# Altium project LogNController-v1.1.PrjPcb (part 3 of 3)

## Sheet Controller-Sheet.SchDoc
size A4; SheetNumber: 3; SheetTotal: 8
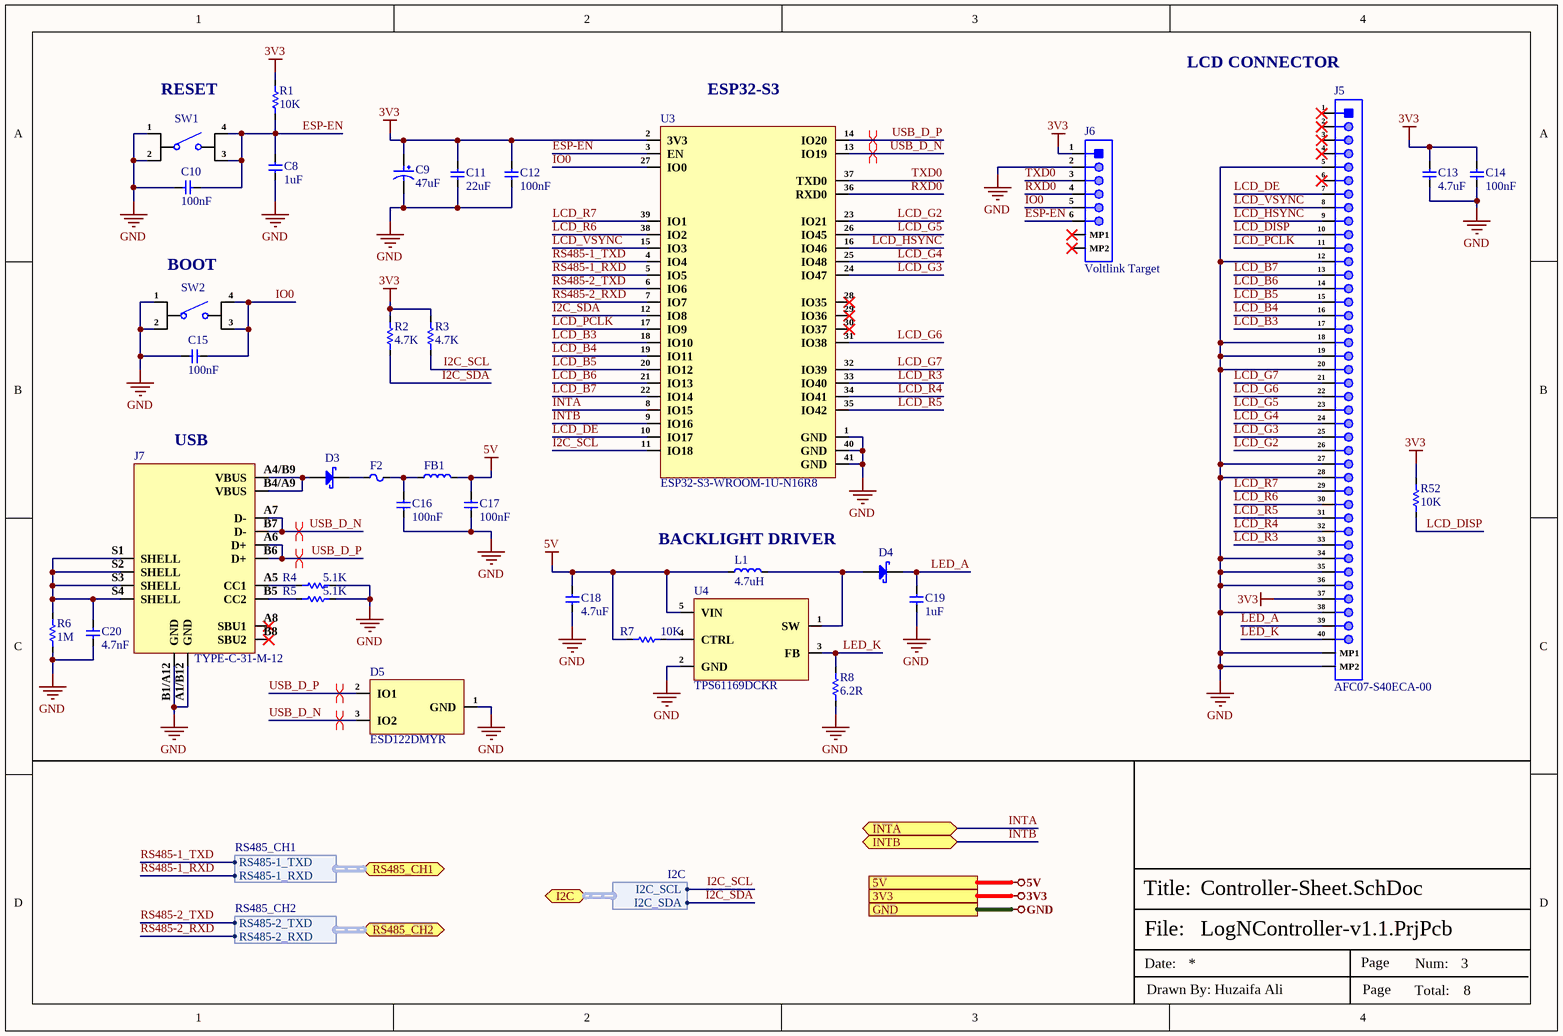
[diagram p7: Controller-Sheet.SchDoc]

### Parts
C8  1uF  [Cap-0603]
C9  47uF  [RVT1H470M0607]
C10  100nF  [Cap-0603]
C11  22uF  [Cap-0603]
C12  100nF  [Cap-0603]
C13  4.7uF  [Cap-0603]
C14  100nF  [Cap-0603]
C15  100nF  [Cap-0603]
C16  100nF  [Cap-0603]
C17  100nF  [Cap-0603]
C18  4.7uF  [Cap-0603]
C19  1uF  [Cap-0603]
C20  4.7nF  [Cap-1206]
D3  SS24A  [SMA]  (value not drawn)
D4  NSR0240HT1G  [SOD-323]  (value not drawn)
D5  ESD122DMYR  [X2-SON-3(0.6x1.3).]
F2  BSMD0603L-100  [fuse-0603]  (value not drawn)
FB1  BLM18SG121TN1D  [IND-0603 (1608 Metric)]  (value not drawn)
J5  AFC07-S40ECA-00  [AFC07-S40ECA-00]
J6  Voltlink Target  [Voltlink Target]
J7  TYPE-C-31-M-12  [TYPE-C-31-M-12_]
L1  4.7uH  [MWSA0402S-4R7MT]
R1  10K  [Res-0603]
R2  4.7K  [Res-0402]
R3  4.7K  [Res-0402]
R4  5.1K  [Res-0402]
R5  5.1K  [Res-0402]
R6  1M  [Res-0603]
R7  10K  [Res-0603]
R8  6.2R  [Res-1206]
R52  10K  [Res-0603]
SW1  TS-1109S-C-B  [TS-1109S-C-B]  (value not drawn)
SW2  TS-1109S-C-B  [TS-1109S-C-B]  (value not drawn)
U3  ESP32-S3-WROOM-1U-N16R8  [41-SMD UFL Module]
U4  TPS61169DCKR  [SC70-5]

### Ports
3V3 (see Top-Sheet[2A], ADC-Sheet[3D], Buttons-Sheet[3D], IO-Expander-Sheet[3D], Power-Sheet[3D], Sensor-Comms-Sheet[3D]), 5V (see Top-Sheet[2A], ADC-Sheet[3D], Power-Sheet[3D], Relay-Sheet[3D]), GND (see Top-Sheet[2A], ADC-Sheet[3D], Buttons-Sheet[3D], IO-Expander-Sheet[3D], Power-Sheet[3D], Relay-Sheet[3D], Sensor-Comms-Sheet[3D]), I2C (bidir, harness I2C, see Top-Sheet[2C], ADC-Sheet[2D], IO-Expander-Sheet[3D]), INTA (bidir, see Top-Sheet[3B], IO-Expander-Sheet[3D]), INTB (bidir, see Top-Sheet[3B], IO-Expander-Sheet[3D]), RS485_CH1 (bidir, harness RS485_CH1, see Top-Sheet[2B], Sensor-Comms-Sheet[1D]), RS485_CH2 (bidir, harness RS485_CH2, see Top-Sheet[2B], Sensor-Comms-Sheet[1D])

### Harnesses
I2C: I2C_SCL, I2C_SDA
RS485_CH2: RS485-2_TXD, RS485-2_RXD
RS485_CH1: RS485-1_TXD, RS485-1_RXD

### Nets
3V3: C9.1 C11.2 C12.2 C13.2 C14.2 J5.37 J6.1 R1.2 R2.2 R3.2 R52.2 U3.2(3V3) ; port 3V3
5V: C17.2 C18.2 FB1.2 L1.1 R7.2 U4.5(VIN) ; port 5V
GND: C8.1 C9.2 C10.2 C11.1 C12.1 C13.1 C14.1 C15.2 C16.1 C17.1 C18.1 C19.1 C20.1 D5.1(GND) J5.5 J5.12 J5.18 J5.19 J5.20 J5.27 J5.28 J5.34 J5.35 J5.36 J5.38 J5.MP1 J5.MP2 J6.2 J7.A1/B12(GND) J7.B1/A12(GND) R4.2 R5.2 R6.1 R8.1 SW1.1 SW1.2 SW2.1 SW2.2 U3.1(GND) U3.40(GND) U3.41(GND) U4.2(GND) ; port GND
ESP-EN: C8.2 C10.1 J6.6 R1.1 SW1.3 SW1.4 U3.3(EN)
I2C_SCL: R3.1 U3.11(IO18) ; port I2C.I2C_SCL
I2C_SDA: R2.1 U3.12(IO8) ; port I2C.I2C_SDA
INTA: U3.8(IO15) ; port INTA
INTB: U3.9(IO16) ; port INTB
IO0: C15.1 J6.5 SW2.3 SW2.4 U3.27(IO0)
LCD_B3: J5.17 U3.18(IO10)
LCD_B4: J5.16 U3.19(IO11)
LCD_B5: J5.15 U3.20(IO12)
LCD_B6: J5.14 U3.21(IO13)
LCD_B7: J5.13 U3.22(IO14)
LCD_DE: J5.7 U3.10(IO17)
LCD_DISP: J5.10 R52.1
LCD_G2: J5.26 U3.23(IO21)
LCD_G3: J5.25 U3.24(IO47)
LCD_G4: J5.24 U3.25(IO48)
LCD_G5: J5.23 U3.26(IO45)
LCD_G6: J5.22 U3.31(IO38)
LCD_G7: J5.21 U3.32(IO39)
LCD_HSYNC: J5.9 U3.16(IO46)
LCD_PCLK: J5.11 U3.17(IO9)
LCD_R3: J5.33 U3.33(IO40)
LCD_R4: J5.32 U3.34(IO41)
LCD_R5: J5.31 U3.35(IO42)
LCD_R6: J5.30 U3.38(IO2)
LCD_R7: J5.29 U3.39(IO1)
LCD_VSYNC: J5.8 U3.15(IO3)
LED_A: C19.2 D4.1(K) J5.39
LED_K: J5.40 R8.2 U4.3(FB)
RS485-1_RXD: U3.5(IO5) ; port RS485_CH1.RS485-1_RXD
RS485-1_TXD: U3.4(IO4) ; port RS485_CH1.RS485-1_TXD
RS485-2_RXD: U3.7(IO7) ; port RS485_CH2.RS485-2_RXD
RS485-2_TXD: U3.6(IO6) ; port RS485_CH2.RS485-2_TXD
RXD0: J6.4 U3.36(RXD0)
TXD0: J6.3 U3.37(TXD0)
USB_D_N: D5.3(IO2) J7.A7(D-) J7.B7(D-) U3.13(IO19)
USB_D_P: D5.2(IO1) J7.A6(D+) J7.B6(D+) U3.14(IO20)
NetC16_2: C16.2 F2.2 FB1.1
NetC20_2: C20.2 J7.S1(SHELL) J7.S2(SHELL) J7.S3(SHELL) J7.S4(SHELL) R6.2
NetD3_1: D3.1(K) F2.1
NetD3_2: D3.2(A) J7.A4/B9(VBUS) J7.B4/A9(VBUS)
NetD4_2: D4.2(A) L1.2 U4.1(SW)
NetJ7_A5: J7.A5(CC1) R4.1
NetJ7_B5: J7.B5(CC2) R5.1
NetR7_1: R7.1 U4.4(CTRL)

Not connected (* = marked no-connect by the designer): J5 1* 2* 3* 4* 6*; J6 MP1* MP2*; J7 A8(SBU1)* B8(SBU2)*; U3 28(IO35)* 29(IO36)* 30(IO37)*

### Layout directives
differential pair; net class USB_PROGRAM; differential pair class USB_PROGRAM_LINES; rule Impedance Constraint [Min = 85.00    Max = 90.00    ]; rule Matched Net Lengths [Tolerance = 50mil]: USB_D_N, USB_D_P

### Notes on the sheet
- (near SW1) RESET
- (near U3) ESP32-S3
- LCD CONNECTOR
- (near SW2) BOOT
- (near J7) USB
- (near L1) BACKLIGHT DRIVER
- File:
- Title:
- Date:
- Page
- Num:
- Total:
- Drawn By: Huzaifa Ali

### Library data of the parts
C8 C19 = CL10A105KB8NNNC: CAP CER 1UF 50V X5R 0603; Manufacturer: Samsung; Material: 4241ConductorMaterial; Tolerance: 10%; Item Type: Capacitor; Supplier: Avnet; Supplier Part Number: CL10A105KB8NNNC; Manufacturer Part Number: CL10A105KB8NNNC; RoHS: Yes; Category: Ceramic Capacitors; Stock: 780446; Pricing: 4000=0.01632, 8000=0.01595, 16000=0.01557, 24000=0.0152, 32000=0.01482 (USD); Mounting Technology: Surface Mount; Case/Package: 0603; Case Code (Metric): 1608; Case Code (Imperial): 0603; Min Operating Temperature: -55°C; Max Operating Temperature: 85°C; Packaging: Tape and Reel; Value: 1uF; Voltage Rating: 50V; Dielectric: X5R; Series: CL; Voltage Rating (DC): 50V; Length: 1.6mm; Depth: 0.8mm; Radiation Hardening: No; RoHS Compliant: Yes; ComponentLink1URL: https://datasheet.ciiva.com/26877/getdatasheetpartid-753736-26877879.pdf?src-supplier=Verical; ComponentLink1Description: https://datasheet.ciiva.com/26877/getdatasheetpartid-753736-26877879.pdf?src-supplier=Verical; LCSC Part Number: C15849
C9 = RVT1H470M0607: 47uF 50V 66mA@120Hz ±20% SMD,D6.3xL7.7mm Aluminum Electrolytic Capacitors - SMD ROHS; Manufacturer: ROQANG; Manufacturer Part Number: RVT1H470M0607; Package: SMD,D6.3xL7.7mm; LCSC Part Number: C72523; Item Type: Capacitor; ComponentLink1Description: LCSC; ComponentLink1URL: https://www.lcsc.com/product-detail/Aluminum-Electrolytic-Capacitors-SMD_ROQANG-RVT1H470M0607_C72523.html
C10 C12 C14-C17 = CC0603KRX5R9BB104: CAP CER 0.1UF 50V X5R 0603; Manufacturer: Yageo; Tolerance: 10%; Item Type: Capacitor; Supplier 1: Digi-Key; Manufacturer Part Number: CC0603KRX5R9BB104; RoHS: Yes; Category: Ceramic Capacitors; Stock 1: 152253; Pricing 1: 1=0.10000, 10=0.05200, 50=0.02820, 100=0.02310, 500=0.01648, 1000=0.01294 (USD); Mount: Surface Mount; Case/Package: 0603; Case Code (Imperial): 0603; Case Code (Metric): 1608; Weight: 7.1E-05oz; Min Operating Temperature: -55°C; Max Operating Temperature: 85°C; Capacitance: 100nF; Packaging: Tape and Reel; Voltage Rating: 50V; Dielectric: X5R; Termination: SMD/SMT; Voltage Rating (DC): 50V; Package Quantity: 4000; Length: 0.063inch; Width: 0.031inch; Thickness: 0.035inch; Lead Free: Lead Free; Halogen Free: Halogen Free; ComponentLink1URL: http://www.mouser.com/ds/2/447/Yageo_UPY-GP_NP0_16V-to-50V_9-358835.pdf?src-supplier=Mouser; ComponentLink1Description: http://www.mouser.com/ds/2/447/Yageo_UPY-GP_NP0_16V-to-50V_9-358835.pdf?src-supplier=Mouser; ComponentLink2URL: https://www.yageo.com/upload/media/product/productsearch/datasheet/mlcc/UPY-GPHC_X5R_4V-to-50V_26.pdf?src-supplier=Digi-Key; ComponentLink2Description: https://www.yageo.com/upload/media/product/productsearch/datasheet/mlcc/UPY-GPHC_X5R_4V-to-50V_26.pdf?src-supplier=Digi-Key; ComponentLink3URL: http://www.yageo.com/exep/pages/download/literatures/ProductSelectionGuide%202014_Final_2.pdf?src-supplier=Digi-Key; ComponentLink3Description: http://www.yageo.com/exep/pages/download/literatures/ProductSelectionGuide%202014_Final_2.pdf?src-supplier=Digi-Key; Supplier Part Number 1: 311-4046-1-ND; LCSC Part Number: C110022
C11 = CC0603MRX5R6BB226: CAP CER 22UF 10V X5R 0603; Manufacturer: Yageo; Tolerance: 20%; Item Type: Capacitor; Supplier 1: Digi-Key; Manufacturer Part Number: CC0603MRX5R6BB226; RoHS: Yes; Category: Ceramic Capacitors; Stock 1: 19628; Pricing 1: 1=0.68000, 10=0.48000, 50=0.36300, 100=0.31610, 500=0.23416, 1000=0.19903 (USD); Mount: Surface Mount; Case/Package: 0603; Case Code (Metric): 1608; Case Code (Imperial): 0603; Weight: 7.1E-05oz; Min Operating Temperature: -55°C; Max Operating Temperature: 85°C; Packaging: Tape and Reel; Capacitance: 22uF; Voltage Rating: 10V; Dielectric: X5R; Termination: SMD/SMT; Voltage Rating (DC): 10V; Package Quantity: 4000; Length: 0.063inch; Width: 0.8mm; Height: 0.8mm; Thickness: 0.035inch; Lead Free: Lead Free; Halogen Free: Halogen Free; RoHS Compliant: Yes; ComponentLink1URL: http://www.mouser.com/ds/2/447/Yageo_UPY-GP_NP0_16V-to-50V_9-358835.pdf?src-supplier=Mouser; ComponentLink1Description: http://www.mouser.com/ds/2/447/Yageo_UPY-GP_NP0_16V-to-50V_9-358835.pdf?src-supplier=Mouser; ComponentLink2URL: http://www.yageo.com/documents/recent/UPY-GPHC_X5R_4V-to-50V_25.pdf?src-supplier=Digi-Key; ComponentLink2Description: http://www.yageo.com/documents/recent/UPY-GPHC_X5R_4V-to-50V_25.pdf?src-supplier=Digi-Key; Supplier Part Number 1: 311-1819-1-ND; LCSC Part Number: C109447
C13 C18 = CC0603KRX5R7BB475: CAP CER 4.7UF 16V X5R 0603; Manufacturer: Yageo; Tolerance: 10%; Item Type: Capacitor; Supplier 1: Digi-Key; Manufacturer Part Number: CC0603KRX5R7BB475; RoHS: Yes; Category: Ceramic Capacitors; Stock 1: 547703; Pricing 1: 1=0.20000, 10=0.13800, 50=0.08280, 100=0.06990, 500=0.04784, 1000=0.04233 (USD); Mount: Surface Mount; Case/Package: 0603; Case Code (Imperial): 0603; Case Code (Metric): 1608; Weight: 7.1E-05oz; Min Operating Temperature: -55°C; Max Operating Temperature: 85°C; Capacitance: 4.7uF; Voltage Rating: 16V; Voltage Rating (DC): 16V; Packaging: Tape and Reel; Dielectric: X5R; Termination: SMD/SMT; Resistor Type: Ceramic; Series: CC; Length: 1.6mm; Width: 0.8mm; Height: 0.8mm; Thickness: 0.037inch; Depth: 0.8mm; Lead Free: Lead Free; Halogen Free: Halogen Free; RoHS Compliant: Yes; ComponentLink1URL: http://www.mouser.com/ds/2/447/UPY-GPHC_X5R_4V-to-50V_25-1131599.pdf?src-supplier=Mouser; ComponentLink1Description: http://www.mouser.com/ds/2/447/UPY-GPHC_X5R_4V-to-50V_25-1131599.pdf?src-supplier=Mouser; ComponentLink2URL: http://www.yageo.com/documents/recent/UPY-GPHC_X5R_4V-to-50V_25.pdf?src-supplier=Digi-Key; ComponentLink2Description: http://www.yageo.com/documents/recent/UPY-GPHC_X5R_4V-to-50V_25.pdf?src-supplier=Digi-Key; Supplier Part Number 1: 311-1785-1-ND; LCSC Part Number: C277476
C20 = CC1206KKX7RCBB472: CAP CER 4700PF 1KV X7R 1206; Manufacturer: Yageo; Dielectric Material: Ceramic; Tolerance: 10%; Item Type: Capacitor; Supplier 1: Future Electronics; Manufacturer Part Number: CC1206KKX7RCBB472; RoHS: Yes; Category: Ceramic Capacitors; Stock 1: 180000; Pricing 1: 3000=0.02860, 9000=0.02750, 15000=0.02700, 45000=0.02600, 75000=0.02510 (USD); Mount: Surface Mount; Case/Package: 1206; Number of Pins: 2; Case Code (Imperial): 1206; Case Code (Metric): 3216; Weight: 0.000571oz; Min Operating Temperature: -55°C; Max Operating Temperature: 125°C; Voltage Rating: 1kV; Capacitance: 4.7nF; Packaging: Tape and Reel; Voltage Rating (DC): 1kV; Dielectric: X7R; Termination: SMD/SMT; Resistor Type: Ceramic; Series: CC; Length: 3.2mm; Width: 0.063inch; Thickness: 0.057inch; Depth: 1.6mm; Radiation Hardening: No; Lead Free: Lead Free; RoHS Compliant: Yes; ComponentLink1URL: https://datasheet.ciiva.com/13208/upy-gp-np0-16v-to-50v-8-13208693.pdf?src-supplier=Mouser; ComponentLink1Description: https://datasheet.ciiva.com/13208/upy-gp-np0-16v-to-50v-8-13208693.pdf?src-supplier=Mouser; ComponentLink2URL: https://datasheet.ciiva.com/11466/hv-11466701.pdf?src-supplier=Avnet; ComponentLink2Description: https://datasheet.ciiva.com/11466/hv-11466701.pdf?src-supplier=Avnet; Supplier Part Number 1: 7130131; LCSC Part Number: C107198
D3 = SS24A: 40V 500mV@2A 2A SMA(DO-214AC) Schottky Barrier Diodes (SBD) ROHS; Manufacturer: Guangdong Hottech; Manufacturer Part Number: SS24A; Package: SMA(DO-214AC); LCSC Part Number: C2886579; ComponentLink1Description: LCSC; ComponentLink1URL: https://www.lcsc.com/product-detail/Schottky-Barrier-Diodes-SBD_Guangdong-Hottech-SS24A_C2886579.html
D4 = NSR0240HT1G: DIODE SCHOTTKY 40V 250MA SOD323; Manufacturer: ON Semiconductor; Value: 4pF; Supplier: Avnet; LCSC Part Number: C152519; Manufacturer Part Number: NSR0240HT1G; RoHS: Yes; Item Type: Diode; Stock: 6655; Pricing: 1=0.272, 25=0.186, 50=0.139, 100=0.091, 250=0.084 (USD); Reverse Voltage: 40V; ComponentLink1URL: https://datasheet.ciiva.com/915/nsr0240h-d-915416.pdf?src-supplier=Digikey; ComponentLink1Description: https://datasheet.ciiva.com/915/nsr0240h-d-915416.pdf?src-supplier=Digikey; ComponentLink2URL: https://datasheet.ciiva.com/915/nsr0240h-d-915417.pdf?src-supplier=Digikey; ComponentLink2Description: https://datasheet.ciiva.com/915/nsr0240h-d-915417.pdf?src-supplier=Digikey; ComponentLink3URL: https://datasheet.ciiva.com/915/nsr0240h-d-915418.pdf?src-supplier=Digikey; ComponentLink3Description: https://datasheet.ciiva.com/915/nsr0240h-d-915418.pdf?src-supplier=Digikey; ComponentLink4URL: https://datasheet.ciiva.com/16396/nsr0240h-d-16396521.pdf?src-supplier=Future+Electronics; ComponentLink4Description: https://datasheet.ciiva.com/16396/nsr0240h-d-16396521.pdf?src-supplier=Future+Electronics
D5 = ESD122DMYR: TVS DIODE 3.6VWM 8.4VC 3X2SON; Manufacturer: Texas Instruments; Interface: USB,GPIO,HDMI,PCIe,SATA; Number of Channels: 2; Reverse Standoff Voltage: 3.6V; Min Breakdown Voltage: 5.1V; Peak Pulse Current: 2.5A; Peak Pulse Power: 20W; Power Line Protection: No; Diode Type: ZENER; Item Type: TVS/ESD; Supplier: Mouser; Supplier Part Number: 595-ESD122DMYR; Manufacturer Part Number: ESD122DMYR; RoHS: Yes; Category: Integrated Circuits (ICs); Stock: 137267; Pricing: 1=0.38, 10=0.33, 50=0.33, 100=0.252, 1000=0.172, 10000=0.152 (USD); Mounting Technology: Surface Mount; Pins: 3; Min Operating Temperature: -40°C; Max Operating Temperature: 125°C; Packaging: Cut Tape; Number of Bidirectional Channels: 2; Series: -; RoHS Compliant: Yes; ComponentLink1URL: http://www.ti.com/general/docs/lit/getliterature.tsp?genericPartNumber=ESD122&fileType=pdf&src-supplier=Farnell; ComponentLink1Description: http://www.ti.com/general/docs/lit/getliterature.tsp?genericPartNumber=ESD122&fileType=pdf&src-supplier=Farnell; ComponentLink2URL: http://www.ti.com/lit/ds/symlink/esd122.pdf?src-supplier=Digikey; ComponentLink2Description: http://www.ti.com/lit/ds/symlink/esd122.pdf?src-supplier=Digikey; ComponentLink3URL: http://www.ti.com/general/docs/suppproductinfo.tsp?distId=10&amp;gotoUrl=http%3A%2F%2Fwww.ti.com%2Flit%2Fgpn%2Fesd122&src-supplier=Digikey; ComponentLink3Description: http://www.ti.com/general/docs/suppproductinfo.tsp?distId=10&amp;gotoUrl=http%3A%2F%2Fwww.ti.com%2Flit%2Fgpn%2Fesd122&src-supplier=Digikey; LCSC Part Number: C1975871
F2 = BSMD0603L-100: 6V 1A 50A 1W -40℃~+85℃ 2A 9mΩ 0.5s 80mΩ 0603 Resettable Fuses ROHS; Manufacturer: BHFUSE; Item Type: Fuse; ComponentLink1Description: LCSC; ComponentLink1URL: https://lcsc.com/product-detail/Resettable-Fuses_BHFUSE-BSMD0603L-100_C2757929.html; Manufacturer Part Number: BSMD0603L-100; Package: 0603; LCSC Part Number: C2757929
FB1 = BLM18SG121TN1D: FERRITE BEAD 120 OHM 0603 1LN; Manufacturer: Murata; Material: Steel,Ferrite; Tolerance: 25%; Impedance: 120R; DC Resistance (DCR): 25mR; Max DC Current: 3A; Number of Lines: 1; Test Frequency: 100MHz; Shielding: Unshielded; Supplier 1: Arrow Electronics; Manufacturer Part Number: BLM18SG121TN1D; RoHS: Yes; Category: Ferrite Beads and Chips; Stock 1: 82612; Pricing 1: 1=0.12640, 10=0.08350, 25=0.07210, 100=0.05150, 250=0.04730, 500=0.04110, 1000=0.03420, 3000=0.03360, 6000=0.03320, 15000=0.03270, 30000=0.03200, 75000=0.03150 (USD); Case/Package: 0603; Number of Pins: 2; Core Material: Ferrite; Case Code (Metric): 1608; Case Code (Imperial): 0603; Min Operating Temperature: -55°C; Max Operating Temperature: 125°C; Package Quantity: 1; Max Current Rating: 3A; Packaging: Tape and Reel; Current Rating: 3A; Termination: SMD/SMT; Frequency: 100MHz; Number of Circuits: 1; Series: BLM18S; DC Resistance-Max: 25mR; Length: 1.6mm; Width: 0.8mm; Height: 0.8mm; Depth: 0.8mm; Reach SVHC Compliant: Yes; Lead Free: Lead Free; RoHS Compliant: Yes; ComponentLink1URL: https://datasheet.ciiva.com/1012/l0110s0100blm18s-1012624.pdf?src-supplier=Digi-Key; ComponentLink1Description: https://datasheet.ciiva.com/1012/l0110s0100blm18s-1012624.pdf?src-supplier=Digi-Key; ComponentLink2URL: https://datasheet.ciiva.com/11799/0900766b811b5866-11799181.pdf?src-supplier=RSComponents; ComponentLink2Description: https://datasheet.ciiva.com/11799/0900766b811b5866-11799181.pdf?src-supplier=RSComponents; ComponentLink3URL: https://datasheet.ciiva.com/18093/getdatasheetpartid-295885-18093249.pdf?src-supplier=Verical; ComponentLink3Description: https://datasheet.ciiva.com/18093/getdatasheetpartid-295885-18093249.pdf?src-supplier=Verical; ComponentLink4URL: https://datasheet.ciiva.com/41449/001171723-da-01-en-chip-drossel0603-120r-3000ma-1-6x0-8mm-41449353.pdf?src-supplier=Conrad; ComponentLink4Description: https://datasheet.ciiva.com/41449/001171723-da-01-en-chip-drossel0603-120r-3000ma-1-6x0-8mm-41449353.pdf?src-supplier=Conrad; ComponentLink5URL: https://datasheet.ciiva.com/41449/001172312-da-01-en-drossel-0603-120r-1-6x0-8mm-10000st-41449675.pdf?src-supplier=Conrad; ComponentLink5Description: https://datasheet.ciiva.com/41449/001172312-da-01-en-drossel-0603-120r-1-6x0-8mm-10000st-41449675.pdf?src-supplier=Conrad; ComponentLink6URL: https://datasheet.ciiva.com/8021/5151-8021511.pdf?src-supplier=Element14; ComponentLink6Description: https://datasheet.ciiva.com/8021/5151-8021511.pdf?src-supplier=Element14; ComponentLink7URL: https://datasheet.ciiva.com/8021/5151-8021512.pdf?src-supplier=Element14; ComponentLink7Description: https://datasheet.ciiva.com/8021/5151-8021512.pdf?src-supplier=Element14; ComponentLink8URL: https://datasheet.ciiva.com/14122/blm-series-eng-tds-14122906.pdf?src-supplier=Distrelec; ComponentLink8Description: https://datasheet.ciiva.com/14122/blm-series-eng-tds-14122906.pdf?src-supplier=Distrelec; ComponentLink9URL: https://datasheet.ciiva.com/1012/l0110s0100blm18s-1012623.pdf?src-supplier=Digi-Key; ComponentLink9Description: https://datasheet.ciiva.com/1012/l0110s0100blm18s-1012623.pdf?src-supplier=Digi-Key; ComponentLink10URL: https://datasheet.ciiva.com/1012/l0110s0100blm18s-1012625.pdf?src-supplier=Digi-Key; ComponentLink10Description: https://datasheet.ciiva.com/1012/l0110s0100blm18s-1012625.pdf?src-supplier=Digi-Key; ComponentLink11URL: https://datasheet.ciiva.com/16395/l0110s0100blm18s-16395498.pdf?src-supplier=Future+Electronics; ComponentLink11Description: https://datasheet.ciiva.com/16395/l0110s0100blm18s-16395498.pdf?src-supplier=Future+Electronics; Supplier Part Number 1: BLM18SG121TN1D; LCSC Part Number: C113030; Item Type: Ferrite Bead
J5 = AFC07-S40ECA-00: SMD,P=0.5mm,Surface Mount，Right Angle; Manufacturer: Jushuo; Item Type: FFC/FPC Connector; Supplier: LCSC; LCSC Part Number: C262648; Manufacturer Part Number: AFC07-S40ECA-00; RoHS: No
J6 = C145963: 1x6P SH 1 1mm 6 SMD,P=1mm Wire To Board / Wire To Wire Connector ROHS; Manufacturer: BOOMELE; Manufacturer Part Number: C145963; Package: SMD,P=1mm; LCSC Part Number: C145963; Item Type: Connector; ComponentLink1Description: LCSC; ComponentLink1URL: https://www.lcsc.com/product-detail/Wire-To-Board-Wire-To-Wire-Connector_BOOMELE-Boom-Precision-Elec-C145963_C145963.html
J7 = TYPE-C-31-M-12: 5A 1 16P Female Type-C SMD USB Connectors ROHS; Manufacturer: Korean Hroparts Elec; ComponentLink1Description: LCSC; ComponentLink1URL: https://www.lcsc.com/product-detail/USB-Connectors_Korean-Hroparts-Elec-TYPE-C-31-M-12_C165948.html; Manufacturer Part Number: TYPE-C-31-M-12; Footprint: Custom; LCSC Part Number: C165948; Item Type: USB Connector
L1 = MWSA0402S-4R7MT: Fixed Ind 4.7UH 2.8A 105MOHM SMD; Manufacturer: Sunlord; Item Type: Inductor; Supplier 1: Digi-Key; Manufacturer Part Number: MWSA0402S-4R7MT; RoHS: No; Category: Fixed Inductors; Stock 1: 2808; Pricing 1: 1=0.88000, 10=0.82100, 25=0.75760, 50=0.63120, 100=0.59340, 250=0.53024, 500=0.45450, 1000=0.40400 (USD); Supplier Part Number 1: 3442-MWSA0402S-4R7MTCT-ND; LCSC Part Number: C408337
R1 R7 R52 = RC0603FR-0710KL: RES SMD 10K Ohm 1% 1/10W 0603; Manufacturer: Yageo; Resistance: 10kR; Temperature Coefficient: 100ppm/°C; Voltage Rating (DC): 50V; Power Rating: 100mW; Voltage Rating: 75V; Item Type: Resistor; Supplier 1: Digi-Key; Manufacturer Part Number: RC0603FR-0710KL; RoHS: Yes; Category: Chip SMD Resistors; Stock 1: 25249139; Pricing 1: 1=0.10000, 10=0.02400, 100=0.00970, 1000=0.00436, 2500=0.00378 (USD); Case/Package: 0603; Number of Pins: 2; Case Code (Imperial): 0603; Case Code (Metric): 1608; Weight: 7.1E-05oz; Size Code: 0603; Min Operating Temperature: -55°C; Max Operating Temperature: 155°C; Tolerance: 1%; Resistor Type: Thick Film; Packaging: Tape and Reel; Termination: SMD/SMT; Features: Moisture Resistant; Series: RC; Max Power Dissipation: 100mW; Number of Terminations: 2; Resistance Tolerance: 1%; Construction: Rectangular; Length: 1.6mm; Width: 0.8mm; Height: 0.45mm; Depth: 0.8mm; Lead Pitch: 0.3mm; REACH SVHC: Unknown; Lead Free: Lead Free; Military Standard: Not; RoHS Compliant: Yes; ComponentLink1URL: https://datasheet.ciiva.com/7660/38590-7660789.pdf?src-supplier=Element14; ComponentLink1Description: https://datasheet.ciiva.com/7660/38590-7660789.pdf?src-supplier=Element14; ComponentLink2URL: https://datasheet.ciiva.com/7983/443971-7983596.pdf?src-supplier=Element14; ComponentLink2Description: https://datasheet.ciiva.com/7983/443971-7983596.pdf?src-supplier=Element14; ComponentLink3URL: https://datasheet.ciiva.com/22747/443971-22747519.pdf?src-supplier=Element14; ComponentLink3Description: https://datasheet.ciiva.com/22747/443971-22747519.pdf?src-supplier=Element14; ComponentLink4URL: https://datasheet.ciiva.com/46440/1868787-46440891.pdf?src-supplier=Element14; ComponentLink4Description: https://datasheet.ciiva.com/46440/1868787-46440891.pdf?src-supplier=Element14; ComponentLink5URL: https://datasheet.ciiva.com/7746/1738695-7746239.pdf?src-supplier=Element14; ComponentLink5Description: https://datasheet.ciiva.com/7746/1738695-7746239.pdf?src-supplier=Element14; ComponentLink6URL: https://datasheet.ciiva.com/15189/getdatasheetpartid-409289-15189591.pdf?src-supplier=Verical; ComponentLink6Description: https://datasheet.ciiva.com/15189/getdatasheetpartid-409289-15189591.pdf?src-supplier=Verical; Supplier Part Number 1: 311-10.0KHRCT-ND; LCSC Part Number: C98220
R2 R3 = RC0402FR-074K7L: RES 4.7K OHM 1% 1/16W 0402; Manufacturer: Yageo; Voltage Rating (DC): 50V; Power Rating: 62.5mW; Resistance: 4.7kR; Temperature Coefficient: 100ppm/°C; Max Power Dissipation: 63mW; Item Type: Resistor; Supplier 1: Avnet; Manufacturer Part Number: RC0402FR-074K7L; RoHS: Yes; Category: Chip SMD Resistors; Stock 1: 2420000; Pricing 1: 10000=0.00085 (USD); Case/Package: 0402; Number of Pins: 2; Case Code (Imperial): 0402; Case Code (Metric): 1005; Size Code: 0402; Min Operating Temperature: -55°C; Max Operating Temperature: 155°C; Tolerance: 1%; Voltage Rating: 50V; Packaging: Tape and Reel; Resistor Type: Thick Film; Termination: SMD/SMT; Features: Moisture Resistant; Series: RC; Number of Terminations: 2; Resistance Tolerance: 1%; Construction: Rectangular; Length: 1mm; Width: 0.5mm; Height: 0.32mm; Depth: 0.5mm; Height - Seated (Max): 0.016inch; RoHS Compliant: Yes; Reach SVHC Compliant: Yes; Military Standard: Not; Lead Free: Lead Free; ComponentLink1URL: https://datasheet.ciiva.com/22661/1686128-22661342.pdf?src-supplier=Element14; ComponentLink1Description: https://datasheet.ciiva.com/22661/1686128-22661342.pdf?src-supplier=Element14; ComponentLink2URL: https://datasheet.ciiva.com/7850/1018594-7850022.pdf?src-supplier=Element14; ComponentLink2Description: https://datasheet.ciiva.com/7850/1018594-7850022.pdf?src-supplier=Element14; ComponentLink3URL: https://datasheet.ciiva.com/7850/1018594-7850023.pdf?src-supplier=Element14; ComponentLink3Description: https://datasheet.ciiva.com/7850/1018594-7850023.pdf?src-supplier=Element14; ComponentLink4URL: https://datasheet.ciiva.com/15215/getdatasheetpartid-328119-15215035.pdf?src-supplier=Verical; ComponentLink4Description: https://datasheet.ciiva.com/15215/getdatasheetpartid-328119-15215035.pdf?src-supplier=Verical; Supplier Part Number 1: RC0402FR-074K7L; LCSC Part Number: C105871
R4 R5 = RC0402FR-075K1L: RES 5.1K OHM 1% 1/16W 0402; Manufacturer: Yageo; Power Rating: 63mW; Resistance: 5.1kR; Temperature Coefficient: 100ppm/°C; Voltage Rating: 50V; Item Type: Resistor; Supplier 1: Avnet; Manufacturer Part Number: RC0402FR-075K1L; RoHS: Yes; Category: Chip SMD Resistors; Stock 1: 65000; Pricing 1: 10000=0.00085 (USD); Case/Package: 0402; Case Code (Metric): 1005; Case Code (Imperial): 0402; Min Operating Temperature: -55°C; Max Operating Temperature: 155°C; Tolerance: 1%; Technology: THICK FILM; Packaging: Tape and Reel; Package Quantity: 1; Resistor Type: Thick Film; Number of Terminations: 2; Termination: SMD/SMT; Max Power Dissipation: 63mW; Voltage Rating (DC): 50V; Working Voltage: 50V; Features: Moisture Resistant; Series: RC; Resistance Tolerance: 1%; Construction: Rectangular; Length: 1mm; Width: 0.02inch; Height: 0.016inch; Depth: 0.5mm; RoHS Compliant: Yes; Military Standard: Not; Lead Free: Lead Free; ComponentLink1URL: https://datasheet.ciiva.com/7983/1018594-7983519.pdf?src-supplier=Element14; ComponentLink1Description: https://datasheet.ciiva.com/7983/1018594-7983519.pdf?src-supplier=Element14; ComponentLink2URL: https://datasheet.ciiva.com/46394/1018594-46394936.pdf?src-supplier=Element14; ComponentLink2Description: https://datasheet.ciiva.com/46394/1018594-46394936.pdf?src-supplier=Element14; ComponentLink3URL: https://datasheet.ciiva.com/2453/pyu-r-int-thick-7-2453401.pdf?src-supplier=Digi-Key; ComponentLink3Description: https://datasheet.ciiva.com/2453/pyu-r-int-thick-7-2453401.pdf?src-supplier=Digi-Key; ComponentLink4URL: https://datasheet.ciiva.com/2453/pyu-r-int-thick-7-2453402.pdf?src-supplier=Digi-Key; ComponentLink4Description: https://datasheet.ciiva.com/2453/pyu-r-int-thick-7-2453402.pdf?src-supplier=Digi-Key; ComponentLink5URL: https://datasheet.ciiva.com/2453/pyu-r-int-thick-7-2453400.pdf?src-supplier=Digi-Key; ComponentLink5Description: https://datasheet.ciiva.com/2453/pyu-r-int-thick-7-2453400.pdf?src-supplier=Digi-Key; ComponentLink6URL: https://datasheet.ciiva.com/12558/pyu-rc0402-51-rohs-l-6-r-8721-12558460.pdf?src-supplier=Mouser; ComponentLink6Description: https://datasheet.ciiva.com/12558/pyu-rc0402-51-rohs-l-6-r-8721-12558460.pdf?src-supplier=Mouser; ComponentLink7URL: https://datasheet.ciiva.com/16744/pyu-rc0402-51-rohs-l-6-r-16744283.pdf?src-supplier=Future+Electronics; ComponentLink7Description: https://datasheet.ciiva.com/16744/pyu-rc0402-51-rohs-l-6-r-16744283.pdf?src-supplier=Future+Electronics; ComponentLink8URL: https://datasheet.ciiva.com/15189/getdatasheetpartid-323636-15189493.pdf?src-supplier=Verical; ComponentLink8Description: https://datasheet.ciiva.com/15189/getdatasheetpartid-323636-15189493.pdf?src-supplier=Verical; Supplier Part Number 1: RC0402FR-075K1L; LCSC Part Number: C105872
R6 = RC0603FR-071ML: RES SMD 1M OHM 1% 1/10W 0603; Manufacturer: Yageo; Voltage Rating: 50V; Resistance: 1MR; Power Rating: 100mW; Temperature Coefficient: 100ppm/°C; Item Type: Resistor; Supplier 1: Digi-Key; Manufacturer Part Number: RC0603FR-071ML; Stock 1: 3824601; Pricing 1: 1=0.1, 10=0.023, 100=0.0094, 1000=0.00421, 2500=0.00366 (USD); Case/Package: 0603; Number of Pins: 2; Case Code (Imperial): 0603; Case Code (Metric): 1608; Min Operating Temperature: -55°C; Max Operating Temperature: 155°C; Voltage Rating (DC): 50V; Tolerance: 1%; Packaging: Tape and Reel; Package Quantity: 5000; Termination: SMD/SMT; Composition: Thick Film; Military Standard: Not; Length: 1.6mm; Height: 0.45mm; Width: 0.8mm; Depth: 0.8mm; REACH SVHC: No SVHC; Lead Free: Lead Free; ComponentLink1URL: http://www.farnell.com/datasheets/2167052.pdf?src-supplier=Mouser; ComponentLink1Description: http://www.farnell.com/datasheets/2167052.pdf?src-supplier=Mouser; ComponentLink2URL: http://www.farnell.com/datasheets/2167052.pdf?src-supplier=Element14; ComponentLink2Description: http://www.farnell.com/datasheets/2167052.pdf?src-supplier=Element14; ComponentLink3URL: http://documents.rs-components.com/techlib://itc_doclist_GB.htm?stockno=5048956&src-supplier=RSComponents; ComponentLink3Description: http://documents.rs-components.com/techlib://itc_doclist_GB.htm?stockno=5048956&src-supplier=RSComponents; Supplier Part Number 1: 311-1.00MHRDKR-ND; LCSC Part Number: C105578
R8 = FRC1206J6R2 TS: 250mW Thick Film Resistors 200V ±5% ±200ppm/℃ 6.2Ω 1206 Chip Resistor - Surface Mount ROHS; Manufacturer: FOJAN; Manufacturer Part Number: FRC1206J6R2 TS; LCSC Part Number: C2907521; Item Type: Resistor; Package: 1206
SW1 SW2 = TS-1109S-C-B: No NO 50mA 4.5mm 100000 260gf 12V -30℃~+85℃ 4.5mm 4.3mm Black Round Button Brick nogging SPST SMD Tactile Switches ROHS; Manufacturer: XKB Connectivity; Item Type: Switch; Manufacturer Part Number: TS-1109S-C-B; Package: Custom; LCSC Part Number: C381037; ComponentLink1Description: LCSC; ComponentLink1URL: https://www.lcsc.com/product-detail/Tactile-Switches_XKB-Connectivity-TS-1109S-C-B_C381037.html
U3 = ESP32-S3-WROOM-1U-N16R8: RF TXRX MOD BLUETOOTH U.FL SMD; Manufacturer: Espressif Systems; Item Type: IC; Supplier: Digikey; LCSC Part Number: C3013946; Manufacturer Part Number: ESP32-S3-WROOM-1U-N16R8; RoHS: No; Stock: 3681; Pricing: 1=3.9 (USD)
U4 = TPS61169DCKR: IC LED DRV RGLTR PWM 1.8A SC70-5; Manufacturer: Texas Instruments; Min Supply Voltage: 2.7V; Nominal Supply Current: 300uA; Supplier: Mouser; LCSC Part Number: C71045; Manufacturer Part Number: TPS61169DCKR; RoHS: Yes; Item Type: IC; Stock: 3338; Pricing: 1=0.87, 10=0.748, 50=0.748, 100=0.577, 1000=0.403, 10000=0.343 (USD); Thickness: 900um; ComponentLink1URL: http://www.ti.com/general/docs/lit/getliterature.tsp?genericPartNumber=TPS61169&&fileType=pdf&src-supplier=Element14; ComponentLink1Description: http://www.ti.com/general/docs/lit/getliterature.tsp?genericPartNumber=TPS61169&&fileType=pdf&src-supplier=Element14; ComponentLink2URL: http://www.ti.com/lit/gpn/tps61169?src-supplier=Mouser; ComponentLink2Description: http://www.ti.com/lit/gpn/tps61169?src-supplier=Mouser; ComponentLink3URL: http://www.ti.com/general/docs/lit/getliterature.tsp?genericPartNumber=TPS61169&amp;&amp;fileType=pdf&src-supplier=Farnell; ComponentLink3Description: http://www.ti.com/general/docs/lit/getliterature.tsp?genericPartNumber=TPS61169&amp;&amp;fileType=pdf&src-supplier=Farnell; ComponentLink4URL: http://www.ti.com/general/docs/lit/getliterature.tsp?genericPartNumber=TPS61169&&fileType=pdf&src-supplier=Avnet; ComponentLink4Description: http://www.ti.com/general/docs/lit/getliterature.tsp?genericPartNumber=TPS61169&&fileType=pdf&src-supplier=Avnet; ComponentLink5URL: http://www.ti.com/lit/ds/symlink/tps61169.pdf?src-supplier=Digikey; ComponentLink5Description: http://www.ti.com/lit/ds/symlink/tps61169.pdf?src-supplier=Digikey

## Nets that join several sheets
3V3: Power-Sheet (C5.1 U2.2 U2.4), Sensor-Comms-Sheet (12 pins), ADC-Sheet (C27.1 R23.2 U8.3 U8.6), Buttons-Sheet (6 pins), IO-Expander-Sheet (5 pins), Controller-Sheet (12 pins)
5V: Power-Sheet (7 pins), ADC-Sheet (6 pins), Relay-Sheet (21 pins), Controller-Sheet (6 pins)
12V-PUMP: Power-Sheet (J4.1), Relay-Sheet (K1.5 K4.5 K7.5)
12V_SENSORS: Power-Sheet (C3.1 C4.2 D2.2 U1.4), Sensor-Comms-Sheet (C22.2 C24.2 J9.1 J11.1)
DCPUMP_GND: Power-Sheet (J4.2), Relay-Sheet (J13.2 J16.2 J19.2)
GND: Power-Sheet (12 pins), Sensor-Comms-Sheet (18 pins), ADC-Sheet (6 pins), Buttons-Sheet (18 pins), IO-Expander-Sheet (5 pins), Relay-Sheet (21 pins), Controller-Sheet (42 pins)
NEUTRAL: Power-Sheet (J1.2 J2.2 U1.2 VR1.1), Relay-Sheet (J14.1 J15.1 J17.1 J18.1)
PHASE: Power-Sheet (F1.1 J1.1 J2.1), Relay-Sheet (K2.5 K3.5 K5.5 K6.5)
AC_MOTOR_9A: IO-Expander-Sheet (U9.5), Relay-Sheet (R45.1)
AIR_PUMP_3A: IO-Expander-Sheet (U9.7), Relay-Sheet (R48.1)
AIR_PUMP_15A: IO-Expander-Sheet (U9.4), Relay-Sheet (R40.1)
ALERT_RDY: ADC-Sheet (R23.1 U7.2), IO-Expander-Sheet (U9.8)
BACK_HOME: Buttons-Sheet (C31.1 R29.2 SW6.1 SW6.2), IO-Expander-Sheet (U9.24)
DC_PUMP-1_12V: IO-Expander-Sheet (U9.1), Relay-Sheet (R38.1)
DC_PUMP-2_12V: IO-Expander-Sheet (U9.2), Relay-Sheet (R44.1)
DC_PUMP-3_12V: IO-Expander-Sheet (U9.3), Relay-Sheet (R50.1)
I2C_SCL: ADC-Sheet (U8.5), IO-Expander-Sheet (U9.12), Controller-Sheet (R3.1 U3.11)
I2C_SDA: ADC-Sheet (U8.4), IO-Expander-Sheet (U9.13), Controller-Sheet (R2.1 U3.12)
INTA: IO-Expander-Sheet (R36.1 U9.20), Controller-Sheet (U3.8)
INTB: IO-Expander-Sheet (R35.1 U9.19), Controller-Sheet (U3.9)
RS485-1_RXD: Sensor-Comms-Sheet (R12.1 R15.2), Controller-Sheet (U3.5)
RS485-1_TXD: Sensor-Comms-Sheet (R11.2 U5.1), Controller-Sheet (U3.4)
RS485-2_RXD: Sensor-Comms-Sheet (R19.1 R22.2), Controller-Sheet (U3.7)
RS485-2_TXD: Sensor-Comms-Sheet (R18.2 U6.1), Controller-Sheet (U3.6)
SCROLL_DOWN: Buttons-Sheet (C29.1 R27.2 SW4.1 SW4.2), IO-Expander-Sheet (U9.22)
SCROLL_UP: Buttons-Sheet (C28.1 R26.2 SW3.1 SW3.2), IO-Expander-Sheet (U9.21)
SELECT: Buttons-Sheet (C30.1 R28.2 SW5.1 SW5.2), IO-Expander-Sheet (U9.23)
START: Buttons-Sheet (C32.1 R30.2 SW7.1 SW7.2), IO-Expander-Sheet (U9.25)
STOP: Buttons-Sheet (C33.1 R31.2 SW8.1 SW8.2), IO-Expander-Sheet (U9.26)
UV_LIGHT_5A: IO-Expander-Sheet (U9.6), Relay-Sheet (R41.1)